# Altium schematic sheet A313_3.SchDoc
size 817 x 513 mm
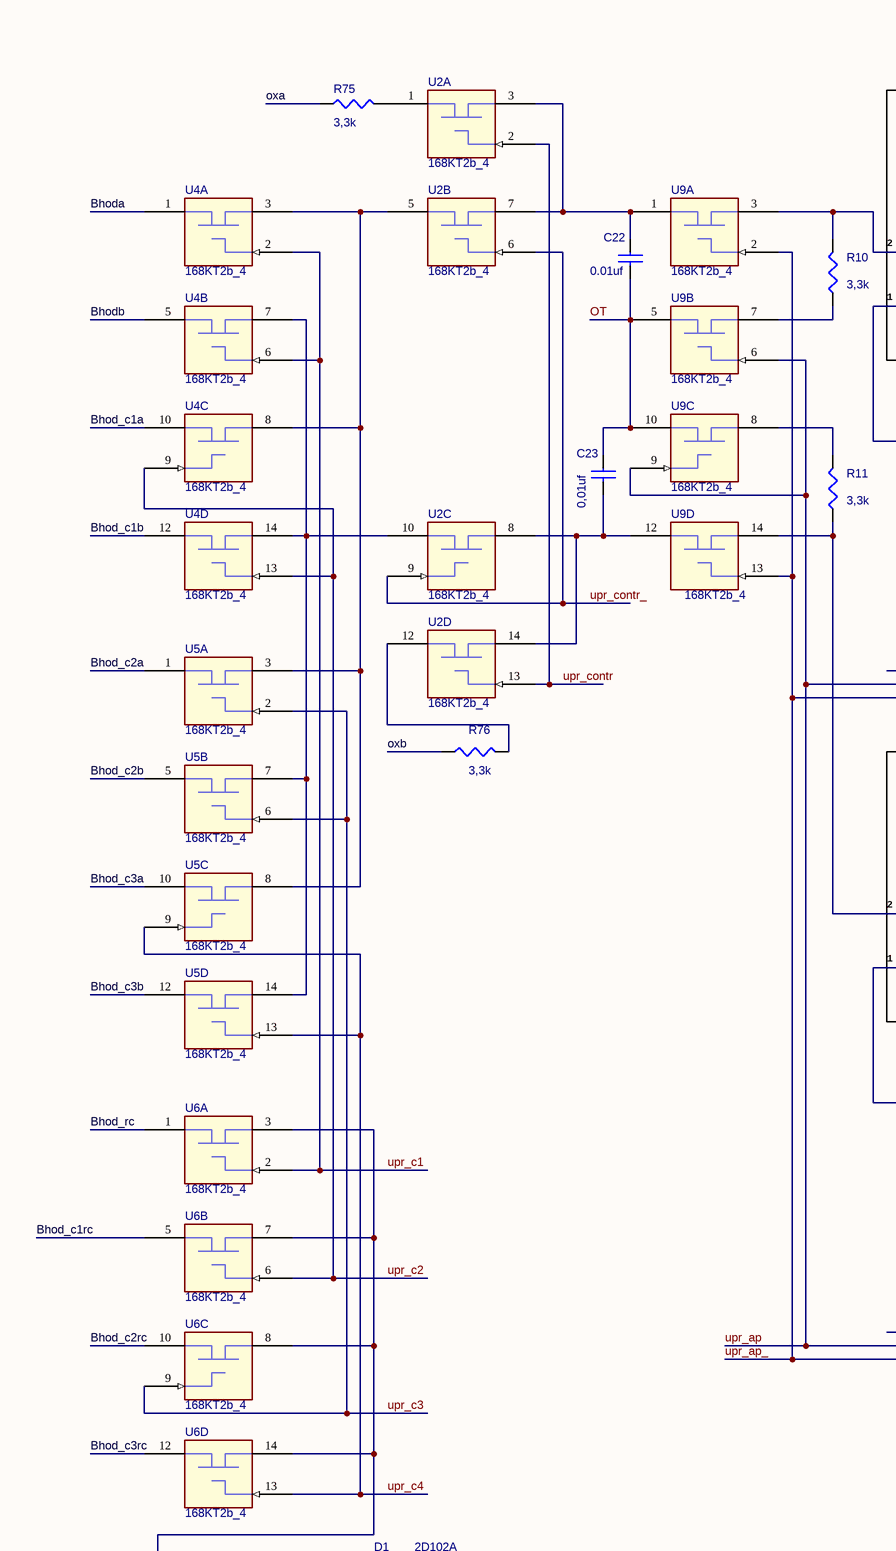
[diagram p0: A313_3.SchDoc, top left]
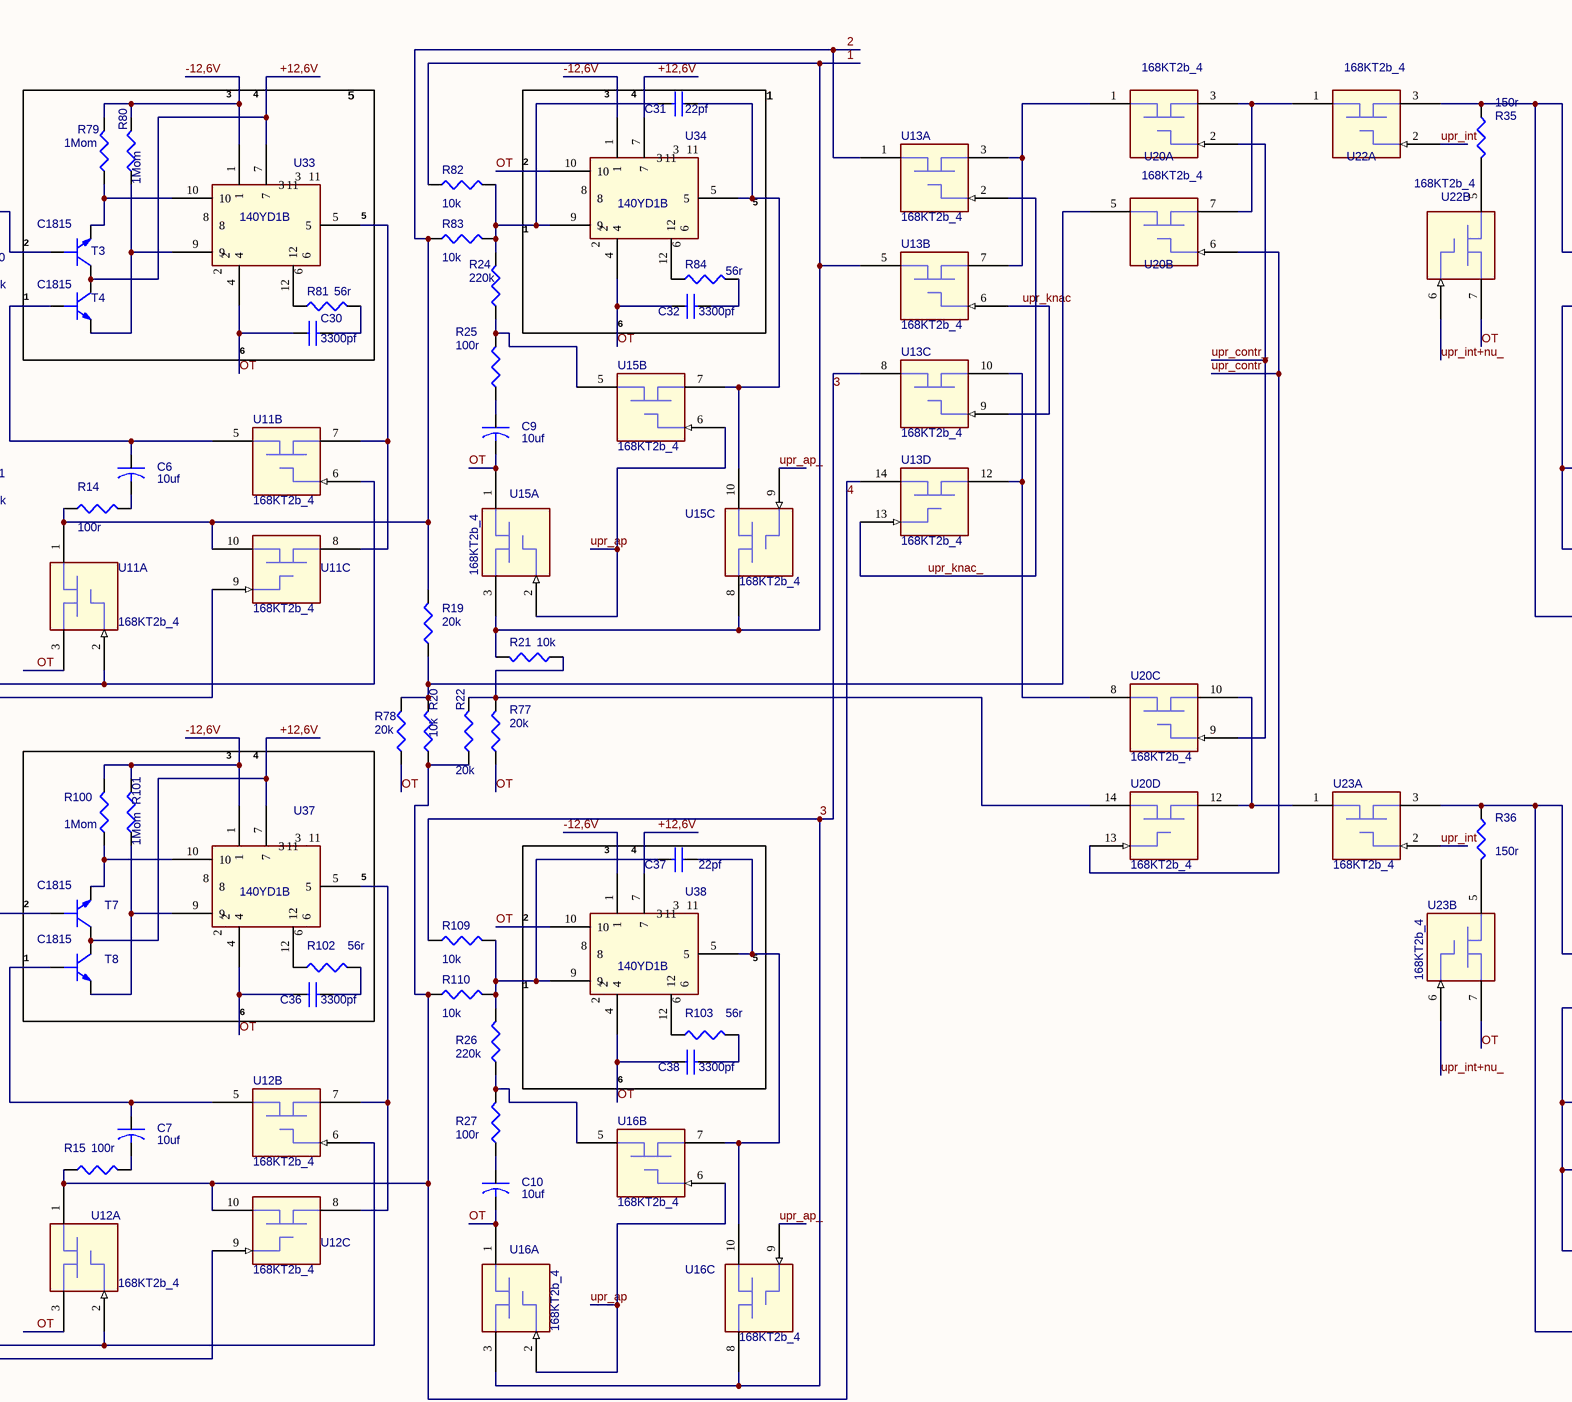
[diagram p1: A313_3.SchDoc, top middle]
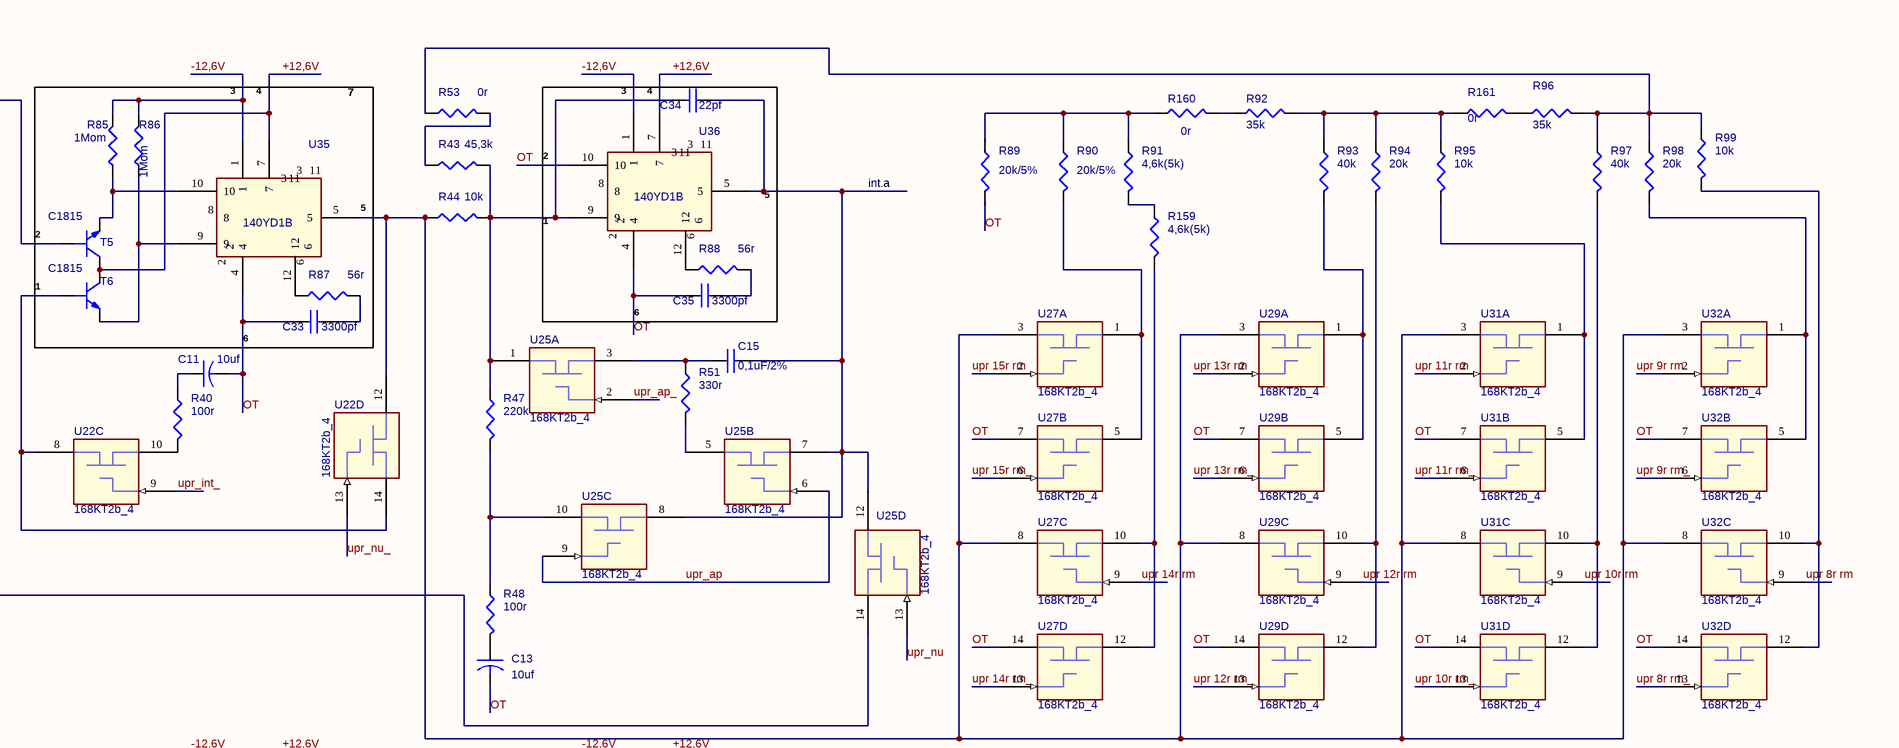
[diagram p2: A313_3.SchDoc, top right]
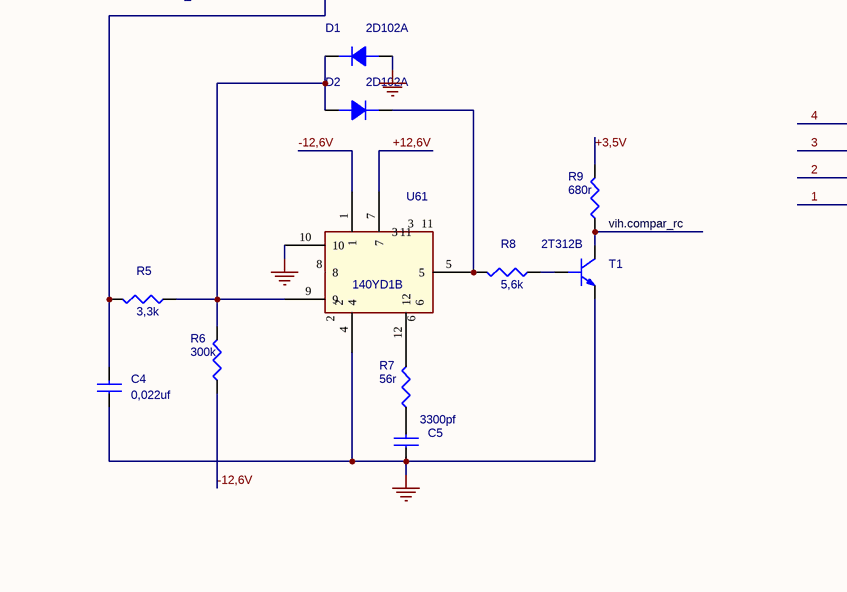
[diagram p3: A313_3.SchDoc, bottom left]
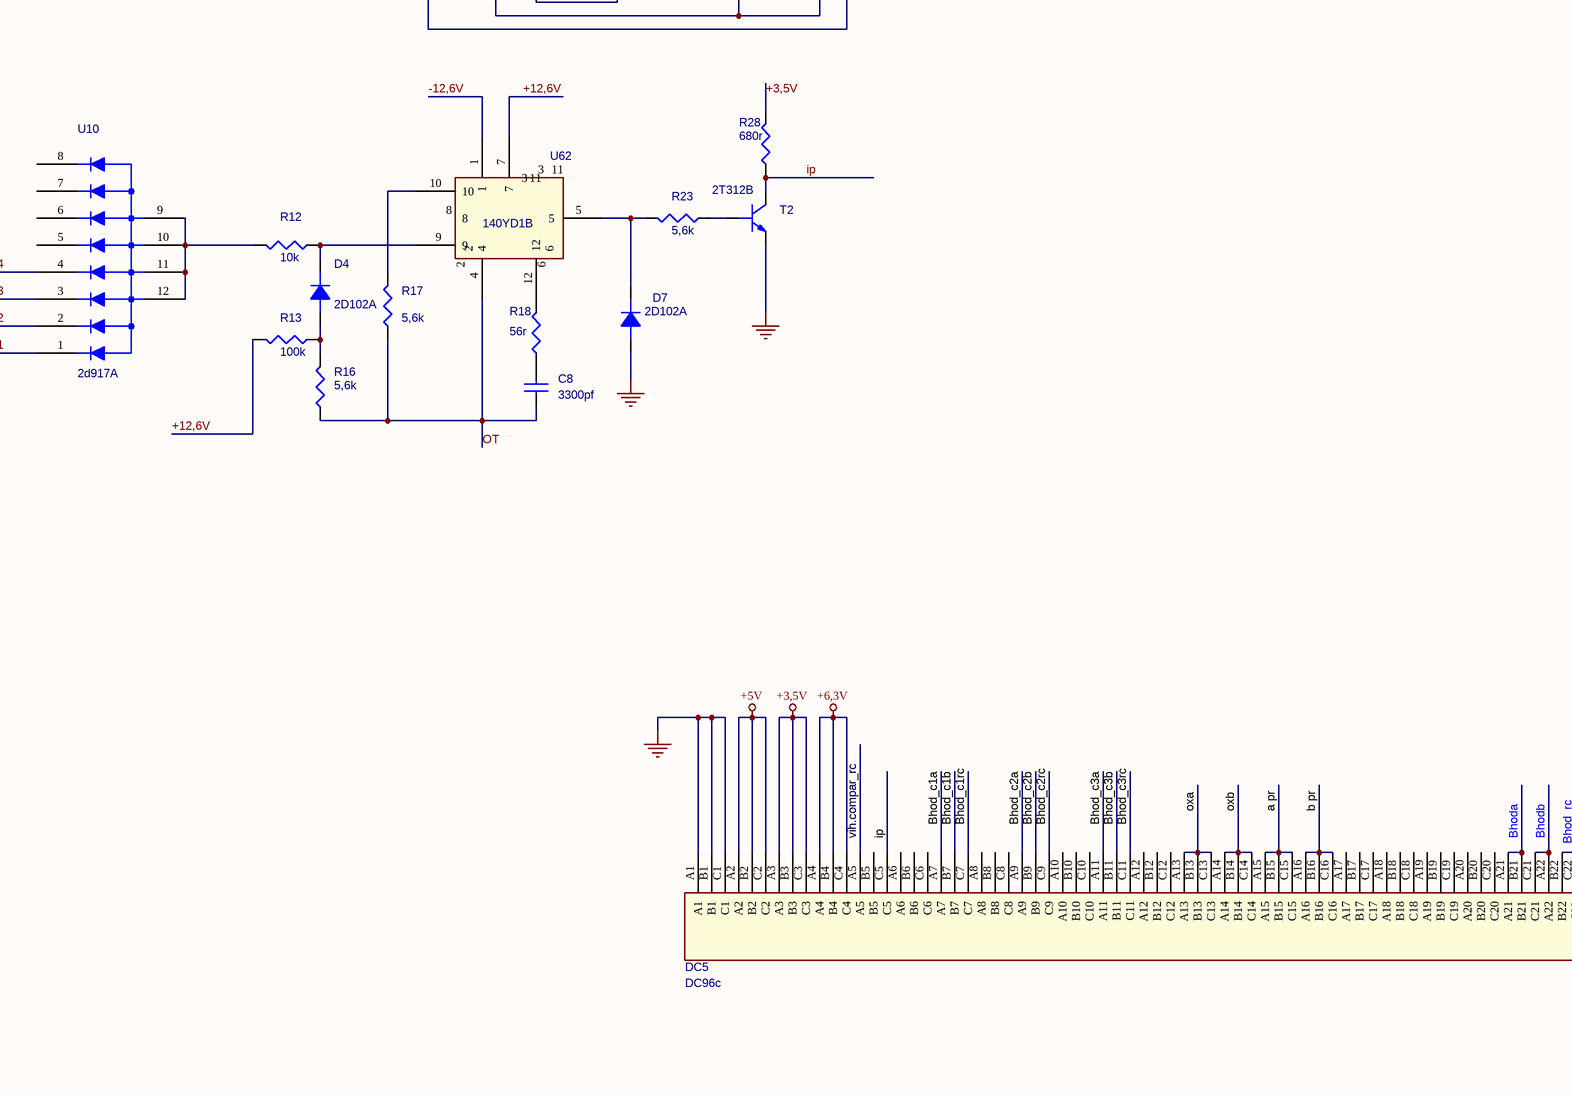
[diagram p4: A313_3.SchDoc, bottom middle]
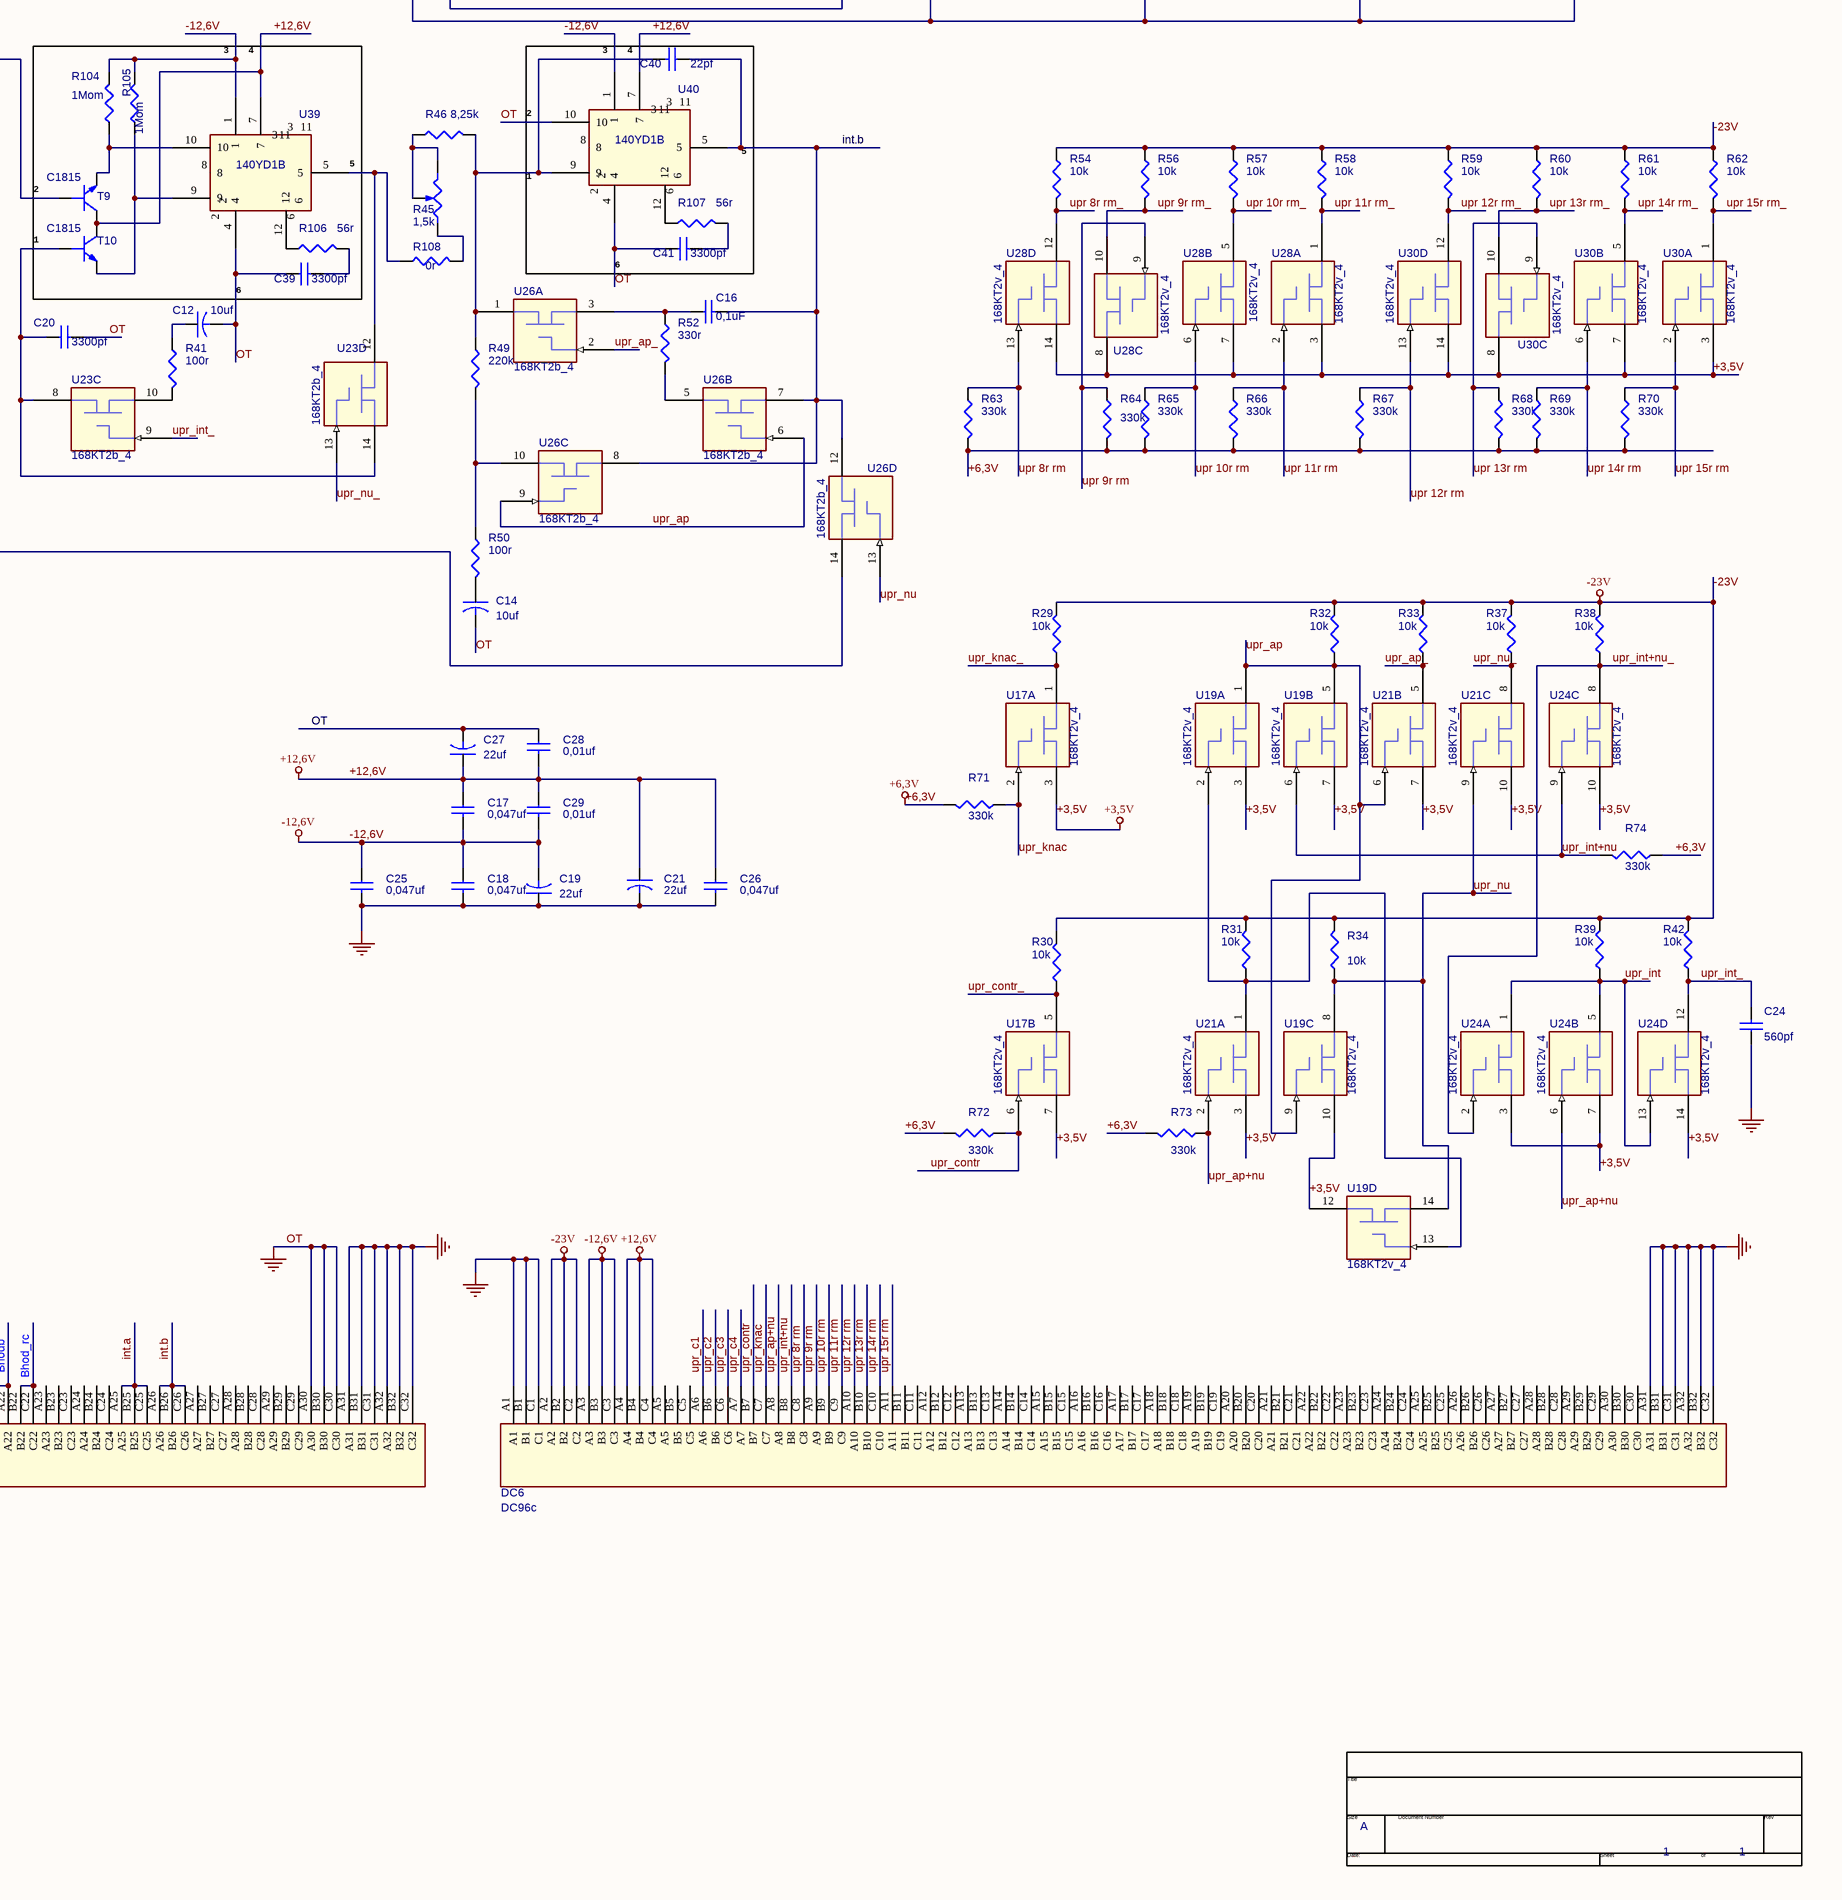
[diagram p5: A313_3.SchDoc, bottom right]

## Parts
*  Page Count: 1  Page Size: A  (hidden comment: TitleBlock0)  (graphical)
C4  0,022uf  [RES_cap 0805]
C5  3300pf  [RES_cap 0805]
C6  10uf  [cap1206]
C7  10uf  [cap1206]
C8  3300pf  [RES_cap 0805]
C9  10uf  [cap1206]
C10  10uf  [cap1206]
C11  10uf  [cap1206]
C12  10uf  [cap1206]
C13  10uf  [cap1206]
C14  10uf  [cap1206]
C15  0,1uF/2%  [K71-7]
C16  0,1uF  [K71-7]
C17  0,047uf  [RES_cap 0805]
C18  0,047uf  [RES_cap 0805]
C19  22uf  [cap1206]
C20  3300pf  [RES_cap 0805]
C21  22uf  [cap1206]
C22  0.01uf  [RES_cap 0805]
C23  0,01uf  [RES_cap 0805]
C24  560pf  [RES_cap 0805]
C25  0,047uf  [RES_cap 0805]
C26  0,047uf  [RES_cap 0805]
C27  22uf  [cap1206]
C28  0,01uf  [RES_cap 0805]
C29  0,01uf  [RES_cap 0805]
C30  3300pf  [RES_cap 0805]
C31  22pf  [KM-5B]
C32  3300pf  [RES_cap 0805]
C33  3300pf  [RES_cap 0805]
C34  22pf  [KM-5B]
C35  3300pf  [RES_cap 0805]
C36  3300pf  [RES_cap 0805]
C37  22pf  [KM-5B]
C38  3300pf  [RES_cap 0805]
C39  3300pf  [RES_cap 0805]
C40  22pf  [KM-5B]
C41  3300pf  [RES_cap 0805]
D1  2D102A  [2D102A]
D2  2D102A  [2D102A]
D4  2D102A  [2D102A]
D7  2D102A  [2D102A]
DC5  DC96c  [DC96c_DUC]
DC6  DC96c  [DC96c_DUC]
R5  3,3k  [RES_cap 0805]
R6  300k  [RES_cap 0805]
R7  56r  [RES_cap 0805]
R8  5,6k  [RES_cap 0805]
R9  680r  [RES_cap 0805]
R10  3,3k  [RES_cap 0805]
R11  3,3k  [RES_cap 0805]
R12  10k  [RES_cap 0805]
R13  100k  [RES_cap 0805]
R14  100r  [RES_cap 0805]
R15  100r  [RES_cap 0805]
R16  5,6k  [RES_cap 0805]
R17  5,6k  [RES_cap 0805]
R18  56r  [RES_cap 0805]
R19  20k  [RES_cap 0805]
R20  10k  [RES_cap 0805]
R21  10k  [RES_cap 0805]
R22  20k  [RES_cap 0805]
R23  5,6k  [RES_cap 0805]
R24  220k  [RES_cap 0805]
R25  100r  [RES_cap 0805]
R26  220k  [RES_cap 0805]
R27  100r  [RES_cap 0805]
R28  680r  [RES_cap 0805]
R29  10k  [RES_cap 0805]
R30  10k  [RES_cap 0805]
R31  10k  [RES_cap 0805]
R32  10k  [RES_cap 0805]
R33  10k  [RES_cap 0805]
R34  10k  [RES_cap 0805]
R35  150r  [RES_cap 0805]
R36  150r  [RES_cap 0805]
R37  10k  [RES_cap 0805]
R38  10k  [RES_cap 0805]
R39  10k  [RES_cap 0805]
R40  100r  [RES_cap 0805]
R41  100r  [RES_cap 0805]
R42  10k  [RES_cap 0805]
R43  45,3k  [RES_cap 0805]
R44  10k  [RES_cap 0805]
R45  1,5k  [CP53]
R46  8,25k  [RES_cap 0805]
R47  220k  [RES_cap 0805]
R48  100r  [RES_cap 0805]
R49  220k  [RES_cap 0805]
R50  100r  [RES_cap 0805]
R51  330r  [RES_cap 0805]
R52  330r  [RES_cap 0805]
R53  0r  [RES_cap 0805]
R54  10k  [RES_cap 0805]
R56  10k  [RES_cap 0805]
R57  10k  [RES_cap 0805]
R58  10k  [RES_cap 0805]
R59  10k  [RES_cap 0805]
R60  10k  [RES_cap 0805]
R61  10k  [RES_cap 0805]
R62  10k  [RES_cap 0805]
R63  330k  [RES_cap 0805]
R64  330k  [RES_cap 0805]
R65  330k  [RES_cap 0805]
R66  330k  [RES_cap 0805]
R67  330k  [RES_cap 0805]
R68  330k  [RES_cap 0805]
R69  330k  [RES_cap 0805]
R70  330k  [RES_cap 0805]
R71  330k  [RES_cap 0805]
R72  330k  [RES_cap 0805]
R73  330k  [RES_cap 0805]
R74  330k  [RES_cap 0805]
R75  3,3k  [RES_cap 0805]
R76  3,3k  [RES_cap 0805]
R77  20k  [RES_cap 0805]
R78  20k  [RES_cap 0805]
R79  1Mom  [RES_cap 0805]
R80  1Mom  [RES_cap 0805]
R81  56r  [RES_cap 0805]
R82  10k  [RES_cap 0805]
R83  10k  [RES_cap 0805]
R84  56r  [RES_cap 0805]
R85  1Mom  [RES_cap 0805]
R86  1Mom  [RES_cap 0805]
R87  56r  [RES_cap 0805]
R88  56r  [RES_cap 0805]
R89  20k/5%  [RES_cap 0805]
R90  20k/5%  [RES_cap 0805]
R91  4,6k(5k)  [RES_cap 0805]
R92  35k  [RES_cap 0805]
R93  40k  [RES_cap 0805]
R94  20k  [RES_cap 0805]
R95  10k  [RES_cap 0805]
R96  35k  [RES_cap 0805]
R97  40k  [RES_cap 0805]
R98  20k  [RES_cap 0805]
R99  10k  [RES_cap 0805]
R100  1Mom  [RES_cap 0805]
R101  1Mom  [RES_cap 0805]
R102  56r  [RES_cap 0805]
R103  56r  [RES_cap 0805]
R104  1Mom  [RES_cap 0805]
R105  1Mom  [RES_cap 0805]
R106  56r  [RES_cap 0805]
R107  56r  [RES_cap 0805]
R108  0r  [RES_cap 0805]
R109  10k  [RES_cap 0805]
R110  10k  [RES_cap 0805]
R159  4,6k(5k)  [RES_cap 0805]
R160  0r  [RES_cap 0805]
R161  0r  [RES_cap 0805]
T1  2T312B  [2T312b]
T2  2T312B  [2T312b]
T3  C1815  [C1815]
T4  C1815  [C1815]
T5  C1815  [C1815]
T6  C1815  [C1815]
T7  C1815  [C1815]
T8  C1815  [C1815]
T9  C1815  [C1815]
T10  C1815  [C1815]
U2  168KT2b_4  [168KT]  (parts A,B,C,D of 4)
U4  168KT2b_4  [168KT]  (parts A,B,C,D of 4)
U5  168KT2b_4  [168KT]  (parts A,B,C,D of 4)
U6  168KT2b_4  [168KT]  (parts A,B,C,D of 4)
U9  168KT2b_4  [168KT]  (parts A,B,C,D of 4)
U10  2d917A  [2D917A]
U11  168KT2b_4  [168KT]  (parts A,B,C of 4)
U12  168KT2b_4  [168KT]  (parts A,B,C of 4)
U13  168KT2b_4  [168KT]  (parts A,B,C,D of 4)
U15  168KT2b_4  [168KT]  (parts A,B,C of 4)
U16  168KT2b_4  [168KT]  (parts A,B,C of 4)
U17  168KT2v_4  [168KT]  (parts A,B of 4)
U19  168KT2v_4  [168KT]  (parts A,B,C,D of 4)
U20  168KT2b_4  [168KT]  (parts A,B,C,D of 4)
U21  168KT2v_4  [168KT]  (parts A,B,C of 4)
U22  168KT2b_4  [168KT]  (parts A,B,C,D of 4)
U23  168KT2b_4  [168KT]  (parts A,B,C,D of 4)
U24  168KT2v_4  [168KT]  (parts A,B,C,D of 4)
U25  168KT2b_4  [168KT]  (parts A,B,C,D of 4)
U26  168KT2b_4  [168KT]  (parts A,B,C,D of 4)
U27  168KT2b_4  [168KT]  (parts A,B,C,D of 4)
U28  168KT2v_4  [168KT]  (parts A,B,C,D of 4)
U29  168KT2b_4  [168KT]  (parts A,B,C,D of 4)
U30  168KT2v_4  [168KT]  (parts A,B,C,D of 4)
U31  168KT2b_4  [168KT]  (parts A,B,C,D of 4)
U32  168KT2b_4  [168KT]  (parts A,B,C,D of 4)
U33  140YD1B  [140YD1B]
U34  140YD1B  [140YD1B]
U35  140YD1B  [140YD1B]
U36  140YD1B  [140YD1B]
U37  140YD1B  [140YD1B]
U38  140YD1B  [140YD1B]
U39  140YD1B  [140YD1B]
U40  140YD1B  [140YD1B]
U61  140YD1B  [140YD1B]
U62  140YD1B  [140YD1B]

## Blocks framed on the sheet
5: C30 R79-R81 T3 T4 U33
7: C33 R85-R87 T5 T6 U35

## Nets
+3,5V: DC5.A3 DC5.B3 DC5.C3 R9.2 R28.2 U17.3(B) U17.7(B) U17.11(+3,5V) U19.3(B) U19.7(B) U19.10(B) U19.11(+3,5V) U19.12(A) U21.3(B) U21.7(B) U21.10(B) U21.11(+3,5V) U24.3(B) U24.7(B) U24.10(B) U24.11(+3,5V) U24.14(B) U28.3(B) U28.7(B) U28.8(A) U28.11(+3,5V) U28.14(B) U30.3(B) U30.7(B) U30.8(A) U30.11(+3,5V) U30.14(B)
+5V: DC5.A2 DC5.B2 DC5.C2
+6,3V: DC5.A4 DC5.B4 DC5.C4 R63.2 R64.2 R65.2 R66.2 R67.2 R68.2 R69.2 R70.2 R71.2 R72.2 R73.2 R74.1 U2.11(+6,3V) U4.11(+6,3V) U5.11(+6,3V) U6.11(+6,3V) U9.11(+6,3V) U11.11(+6,3V) U12.11(+6,3V) U13.11(+6,3V) U15.11(+6,3V) U16.11(+6,3V) U20.11(+6,3V) U22.11(+6,3V) U23.11(+6,3V) U25.11(+6,3V) U26.11(+6,3V) U27.11(+6,3V) U29.11(+6,3V) U31.11(+6,3V) U32.11(+6,3V)
+12,6V: C17.1 C21.1 C26.1 C27.1 C28.2 C29.1 DC6.A4 DC6.B4 DC6.C4 R13.2 T3.2(C) T4.2(C) T5.2(C) T6.2(C) T7.2(C) T8.2(C) T9.2(C) T10.2(C) U33.7 U34.7 U35.7 U36.7 U37.7 U38.7 U39.7 U40.7 U61.7 U62.7
-12,6V: C17.2 C18.1 C19.2 C25.1 C29.2 DC6.A3 DC6.B3 DC6.C3 R6.1 R79.2 R80.2 R85.2 R86.2 R100.2 R101.2 R104.2 R105.2 U33.1 U34.1 U35.1 U36.1 U37.1 U38.1 U39.1 U40.1 U61.1 U62.1
-23V: DC6.A2 DC6.B2 DC6.C2 R29.2 R30.2 R31.2 R32.2 R33.2 R34.2 R37.2 R38.2 R39.2 R42.2 R54.1 R56.1 R57.1 R58.1 R59.1 R60.1 R61.1 R62.1
OT: C4.1 C5.1 C8.1 C9.2 C10.2 C11.2 C12.2 C13.2 C14.2 C18.2 C19.1 C20.2 C21.2 C22.2 C23.1 C24.1 C25.2 C26.2 C27.2 C28.1 C30.1 C32.1 C33.1 C35.1 C36.1 C38.1 C39.1 C41.1 D1.1(A) D7.1(A) DC5.A1 DC5.A30 DC5.A31 DC5.A32 DC5.B1 DC5.B30 DC5.B31 DC5.B32 DC5.C1 DC5.C30 DC5.C31 DC5.C32 DC6.A1 DC6.A31 DC6.A32 DC6.B1 DC6.B31 DC6.B32 DC6.C1 DC6.C31 DC6.C32 R16.1 R17.1 R77.1 R78.1 R89.2 T1.2(E) T2.2(E) U9.5(A) U9.10(B) U11.3(B) U12.3(B) U15.1(A) U16.1(A) U22.7(B) U23.7(B) U27.7(B) U27.14(B) U29.7(B) U29.14(B) U31.7(B) U31.14(B) U32.7(B) U32.14(B) U33.4 U34.4 U34.10 U35.4 U36.4 U36.10 U37.4 U38.4 U38.10 U39.4 U40.4 U40.10 U61.4 U61.10 U62.4  [also labelled GND]
1: R21.2 R82.1 U10.1 U13.5(A) U15.3(B) U15.8(A)
2: R14.1 R19.2 R83.1 U10.2 U11.1(A) U11.10(B) U13.1(A)
3: R109.1 U10.3 U13.8(A) U16.3(B) U16.8(A)
4: R15.1 R20.1 R22.1 R110.1 U10.4 U12.1(A) U12.10(B) U13.14(B)
a pr: DC5.A15 DC5.B15 DC5.C15
b pr: DC5.A16 DC5.B16 DC5.C16
Bhod_c1a: DC5.A7 U4.10(B)
Bhod_c1b: DC5.B7 U4.12(A)
Bhod_c1rc: DC5.C7 U6.5(A)
Bhod_c2a: DC5.A9 U5.1(A)
Bhod_c2b: DC5.B9 U5.5(A)
Bhod_c2rc: DC5.C9 U6.10(B)
Bhod_c3a: DC5.A11 U5.10(B)
Bhod_c3b: DC5.B11 U5.12(A)
Bhod_c3rc: DC5.C11 U6.12(A)
Bhod_rc: DC5.B22 DC5.C22 U6.1(A)
Bhoda: DC5.A21 DC5.B21 U4.1(A)
Bhodb: DC5.A22 DC5.C21 U4.5(A)
int.a: C15.2 C34.1 DC5.A25 DC5.B25 DC5.C25 U25.7(B) U25.8(A) U25.12(A) U36.5
int.b: C16.2 C40.1 DC5.A26 DC5.B26 DC5.C26 U26.7(B) U26.8(A) U26.12(A) U40.5
ip: DC5.C5 R28.1 T2.1(C)
oxa: DC5.A13 DC5.B13 DC5.C13 R75.1
oxb: DC5.A14 DC5.B14 DC5.C14 R76.1
upr 8r rm: DC6.C8 R63.1 U28.13(C) U32.9(C)
upr 8r rm_: R54.2 U28.12(A) U32.13(C)
upr 9r rm: DC6.A9 R64.1 U28.9(C) U32.2(C)
upr 9r rm_: R56.2 U28.10(B) U32.6(C)
upr 10r rm: DC6.B9 R65.1 U28.6(C) U31.9(C)
upr 10r rm_: R57.2 U28.5(A) U31.13(C)
upr 11r rm: DC6.C9 R66.1 U28.2(C) U31.2(C)
upr 11r rm_: R58.2 U28.1(A) U31.6(C)
upr 12r rm: DC6.A10 R67.1 U29.9(C) U30.13(C)
upr 12r rm_: R59.2 U29.13(C) U30.12(A)
upr 13r rm: DC6.B10 R68.1 U29.2(C) U30.9(C)
upr 13r rm_: R60.2 U29.6(C) U30.10(B)
upr 14r rm: DC6.C10 R69.1 U27.9(C) U30.6(C)
upr 14r rm_: R61.2 U27.13(C) U30.5(A)
upr 15r rm: DC6.A11 R70.1 U27.2(C) U30.2(C)
upr 15r rm_: R62.2 U27.6(C) U30.1(A)
upr_ap: R32.1 U9.6(C) U9.9(C) U11.2(C) U11.6(C) U12.2(C) U12.6(C) U15.2(C) U15.6(C) U16.2(C) U16.6(C) U19.1(A) U19.5(A) U19.9(C) U21.6(C) U25.6(C) U25.9(C) U26.6(C) U26.9(C)
upr_ap+nu: DC6.A8 R73.1 U21.2(C) U24.6(C)
upr_ap_: R33.1 U9.2(C) U9.13(C) U11.9(C) U12.9(C) U15.9(C) U16.9(C) U21.5(A) U25.2(C) U26.2(C)
upr_c1: DC6.A6 U4.2(C) U4.6(C) U6.2(C)
upr_c2: DC6.B6 U4.9(C) U4.13(C) U6.6(C)
upr_c3: DC6.C6 U5.2(C) U5.6(C) U6.9(C)
upr_c4: DC6.A7 U5.9(C) U5.13(C) U6.13(C)
upr_contr: DC6.B7 R72.1 U2.2(C) U2.13(C) U17.6(C) U20.6(C) U20.13(C)
upr_contr_: R30.1 U2.6(C) U2.9(C) U17.5(A) U20.2(C) U20.9(C)
upr_int: R39.1 U22.2(C) U23.2(C) U24.1(A) U24.5(A) U24.13(C)
upr_int+nu: DC6.B8 R74.2 U19.6(C) U24.9(C)
upr_int+nu_: R38.1 U22.6(C) U23.6(C) U24.2(C) U24.8(A)
upr_int_: C24.2 R42.1 U22.9(C) U23.9(C) U24.12(A)
upr_knac: DC6.C7 R71.1 U13.6(C) U13.9(C) U17.2(C)
upr_knac_: R29.1 U13.2(C) U13.13(C) U17.1(A)
upr_nu: R34.1 U19.8(A) U19.14(B) U21.9(C) U25.13(C) U26.13(C)
upr_nu_: R37.1 U21.8(A) U22.13(C) U23.13(C)
vih.compar_rc: DC5.A5 R9.1 T1.1(C)
NetC4_2: C4.2 R5.2 U6.3(B) U6.7(B) U6.8(A) U6.14(B)
NetC5_2: C5.2 R7.1
NetC6_1: C6.1 T4.1(B) U11.5(A)
NetC6_2: C6.2 R14.2
NetC7_1: C7.1 T8.1(B) U12.5(A)
NetC7_2: C7.2 R15.2
NetC8_2: C8.2 R18.1
NetC9_1: C9.1 R25.1
NetC10_1: C10.1 R27.1
NetC11_1: C11.1 R40.1
NetC12_1: C12.1 R41.1
NetC13_1: C13.1 R48.2
NetC14_1: C14.1 R50.2
NetC15_1: C15.1 R51.1 U25.3(B)
NetC16_1: C16.1 R52.1 U26.3(B)
NetC20_1: C20.1 T10.1(B) U23.8(A) U23.14(B)
NetC22_1: C22.1 U2.3(B) U2.7(B) U9.1(A)
NetC23_2: C23.2 U2.8(A) U2.14(B) U9.12(A)
NetC30_2: C30.2 R81.2
NetC31_1: C31.1 U15.7(B) U15.10(B) U34.5
NetC31_2: C31.2 R24.2 R82.2 R83.2 U34.9
NetC32_2: C32.2 R84.2
NetC33_2: C33.2 R87.2
NetC34_2: C34.2 R43.2 R44.2 R47.1 U25.1(A) U36.9
NetC35_2: C35.2 R88.2
NetC36_2: C36.2 R102.2
NetC37_1: C37.1 U16.7(B) U16.10(B) U38.5
NetC37_2: C37.2 R26.2 R109.2 R110.2 U38.9
NetC38_2: C38.2 R103.2
NetC39_2: C39.2 R106.2
NetC40_2: C40.2 R46.2 R49.1 U26.1(A) U40.9
NetC41_2: C41.2 R107.2
NetD1_2: D1.2(K) D2.1(A) R5.1 R6.2 U61.9
NetD2_2: D2.2(K) R8.2 U61.5
NetD4_1: D4.1(A) R13.1 R16.2
NetD4_2: D4.2(K) R12.1 U62.9
NetD7_2: D7.2(K) R23.2 U62.5
NetR7_2: R7.2 U61.12
NetR8_1: R8.1 T1.3(B)
NetR10_1: R10.1 U9.7(B)
NetR10_2: R10.2 T3.1(B) U9.3(B)
NetR11_1: R11.1 T7.1(B) U9.14(B)
NetR11_2: R11.2 U9.8(A)
NetR12_2: R12.2 U10.9 U10.10 U10.11 U10.12
NetR17_2: R17.2 U62.10
NetR18_2: R18.2 U62.12
NetR19_1: R19.1 R20.2 R78.2 U20.5(A)
NetR21_1: R21.1 R22.2 R77.2 U20.14(B)
NetR23_1: R23.1 T2.3(B)
NetR24_1: R24.1 R25.2 U15.5(A)
NetR26_1: R26.1 R27.2 U16.5(A)
NetR31_1: R31.1 U19.2(C) U19.13(C) U21.1(A)
NetR35_1: R35.1 T5.1(B) U22.3(B) U25.14(B)
NetR35_2: R35.2 U22.5(A)
NetR36_1: R36.1 T9.1(B) U23.3(B) U26.14(B)
NetR36_2: R36.2 U23.5(A)
NetR40_2: R40.2 U22.10(B)
NetR41_2: R41.2 U23.10(B)
NetR43_1: R43.1 R53.2
NetR44_1: R44.1 U22.12(A) U27.3(B) U27.8(A) U29.3(B) U29.8(A) U31.3(B) U31.8(A) U32.3(B) U32.8(A) U35.5
NetR45_1: R45.1(A) R108.2
NetR45_2: R45.2(WIPER) R45.3(B) R46.1
NetR47_2: R47.2 R48.1 U25.10(B)
NetR49_2: R49.2 R50.1 U26.10(B)
NetR51_2: R51.2 U25.5(A)
NetR52_2: R52.2 U26.5(A)
NetR53_1: R53.1 R96.2 R97.1 R98.1 R99.1
NetR75_2: R75.2 U2.1(A)
NetR76_2: R76.2 U2.12(A)
NetR79_1: R79.1 T3.3(E) U33.10
NetR80_1: R80.1 T4.3(E) U33.9
NetR81_1: R81.1 U33.12
NetR84_1: R84.1 U34.12
NetR85_1: R85.1 T5.3(E) U35.10
NetR86_1: R86.1 T6.3(E) U35.9
NetR87_1: R87.1 U35.12
NetR88_1: R88.1 U36.12
NetR89_1: R89.1 R90.1 R91.1 R160.1
NetR90_2: R90.2 U27.1(A) U27.5(A)
NetR91_2: R91.2 R159.1
NetR92_1: R92.1 R160.2
NetR92_2: R92.2 R93.1 R94.1 R95.1 R161.1
NetR93_2: R93.2 U29.1(A) U29.5(A)
NetR94_2: R94.2 U29.10(B) U29.12(A)
NetR95_2: R95.2 U31.1(A) U31.5(A)
NetR96_1: R96.1 R161.2
NetR97_2: R97.2 U31.10(B) U31.12(A)
NetR98_2: R98.2 U32.1(A) U32.5(A)
NetR99_2: R99.2 U32.10(B) U32.12(A)
NetR100_1: R100.1 T7.3(E) U37.10
NetR101_1: R101.1 T8.3(E) U37.9
NetR102_1: R102.1 U37.12
NetR103_1: R103.1 U38.12
NetR104_1: R104.1 T9.3(E) U39.10
NetR105_1: R105.1 T10.3(E) U39.9
NetR106_1: R106.1 U39.12
NetR107_1: R107.1 U40.12
NetR108_1: R108.1 U23.12(A) U39.5
NetR159_2: R159.2 U27.10(B) U27.12(A)
NetT6_1: T6.1(B) U22.8(A) U22.14(B)
NetU2_5: U2.5(A) U4.3(B) U4.8(A) U5.3(B) U5.8(A)
NetU2_10: U2.10(B) U4.7(B) U4.14(B) U5.7(B) U5.14(B)
NetU11_7: U11.7(B) U11.8(A) U33.5
NetU12_7: U12.7(B) U12.8(A) U37.5
NetU13_3: U13.3(B) U13.7(B) U20.1(A)
NetU13_10: U13.10(B) U13.12(A) U20.8(A)
NetU20_3: U20.3(B) U20.7(B) U22.1(A)
NetU20_10: U20.10(B) U20.12(A) U23.1(A)

Not connected (* = marked no-connect by the designer): DC5 A6 A8 A10 A12 A17 A18 A19 A20 A23 A24 A27 A28 A29 B5 B6 B8 B10 B12 B17 B18 B19 B20 B23 B24 B27 B28 B29 C6 C8 C10 C12 C17 C18 C19 C20 C23 C24 C27 C28 C29; DC6 A5 A12 A13 A14 A15 A16 A17 A18 A19 A20 A21 A22 A23 A24 A25 A26 A27 A28 A29 A30 B5 B11 B12 B13 B14 B15 B16 B17 B18 B19 B20 B21 B22 B23 B24 B25 B26 B27 B28 B29 B30 C5 C11 C12 C13 C14 C15 C16 C17 C18 C19 C20 C21 C22 C23 C24 C25 C26 C27 C28 C29 C30; U10 5 6 7 8; U33 2 3 6 8 11; U34 2 3 6 8 11; U35 2 3 6 8 11; U36 2 3 6 8 11; U37 2 3 6 8 11; U38 2 3 6 8 11; U39 2 3 6 8 11; U40 2 3 6 8 11; U61 2 3 6 8 11; U62 2 3 6 8 11

## Notes on the sheet
- 3
- 4
- 1
- 2
- 5
- (near U33) 5
- (near U35) 5
- 6
- (near U37) 5
- (near U39) 5
- (in symbol TitleBlock0) Title; Size; Document Number; Rev; Date:; Sheet; of

## Library data of the parts
C4 C5 C8 C15-C18 C20 C22-C26 C28-C41 = CAP NP
C6 C7 C9-C14 = CAP
C19 C21 C27 = C
D1 D2 D4 D7 = DIODE
R5-R44 R46-R54 R56-R110 R159-R161 = R
R45 = RESISTOR VAR
T1 = 1R1001_2
T2 = 1R1001_1
T3-T10 = 1R1001
U10 = LDS-A81R_4
U17 = 168KT2b_10
U19 = 168KT2b_12
U21 = 168KT2b_18
U24 = 168KT2b_20
U28 = 168KT2b_27
U30 = 168KT2b_31
U33-U40 U61 U62 = 140YD1B_0
* = TitleBlock0: Page Number: 1; Page Create Date: March  8, 1995